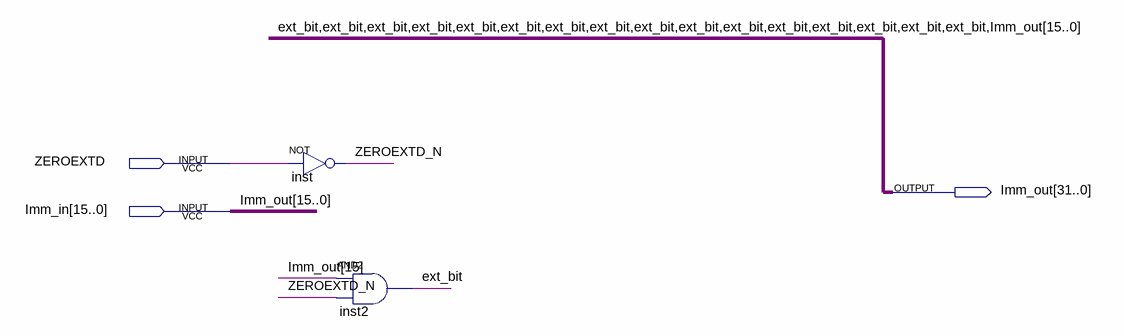
[diagram p0: schematic sheet]
// Quartus schematic Sign_Ex.bdf as structural Verilog: 2 symbols, 3 pins
module Sign_Ex (
  input  ZEROEXTD,
  input  [15:0] Imm_in,
  output [31:0] Imm_out
);

  wire ext_bit, ZEROEXTD_N;

  not inst (ZEROEXTD_N, ZEROEXTD);
  and inst2 (ext_bit, Imm_in[15], ZEROEXTD_N);

  assign Imm_out[15:0] = Imm_in;
endmodule
